# Altium schematic sheet Tape Array.SchDoc
size A; SheetNumber: 2; SheetTotal: 4
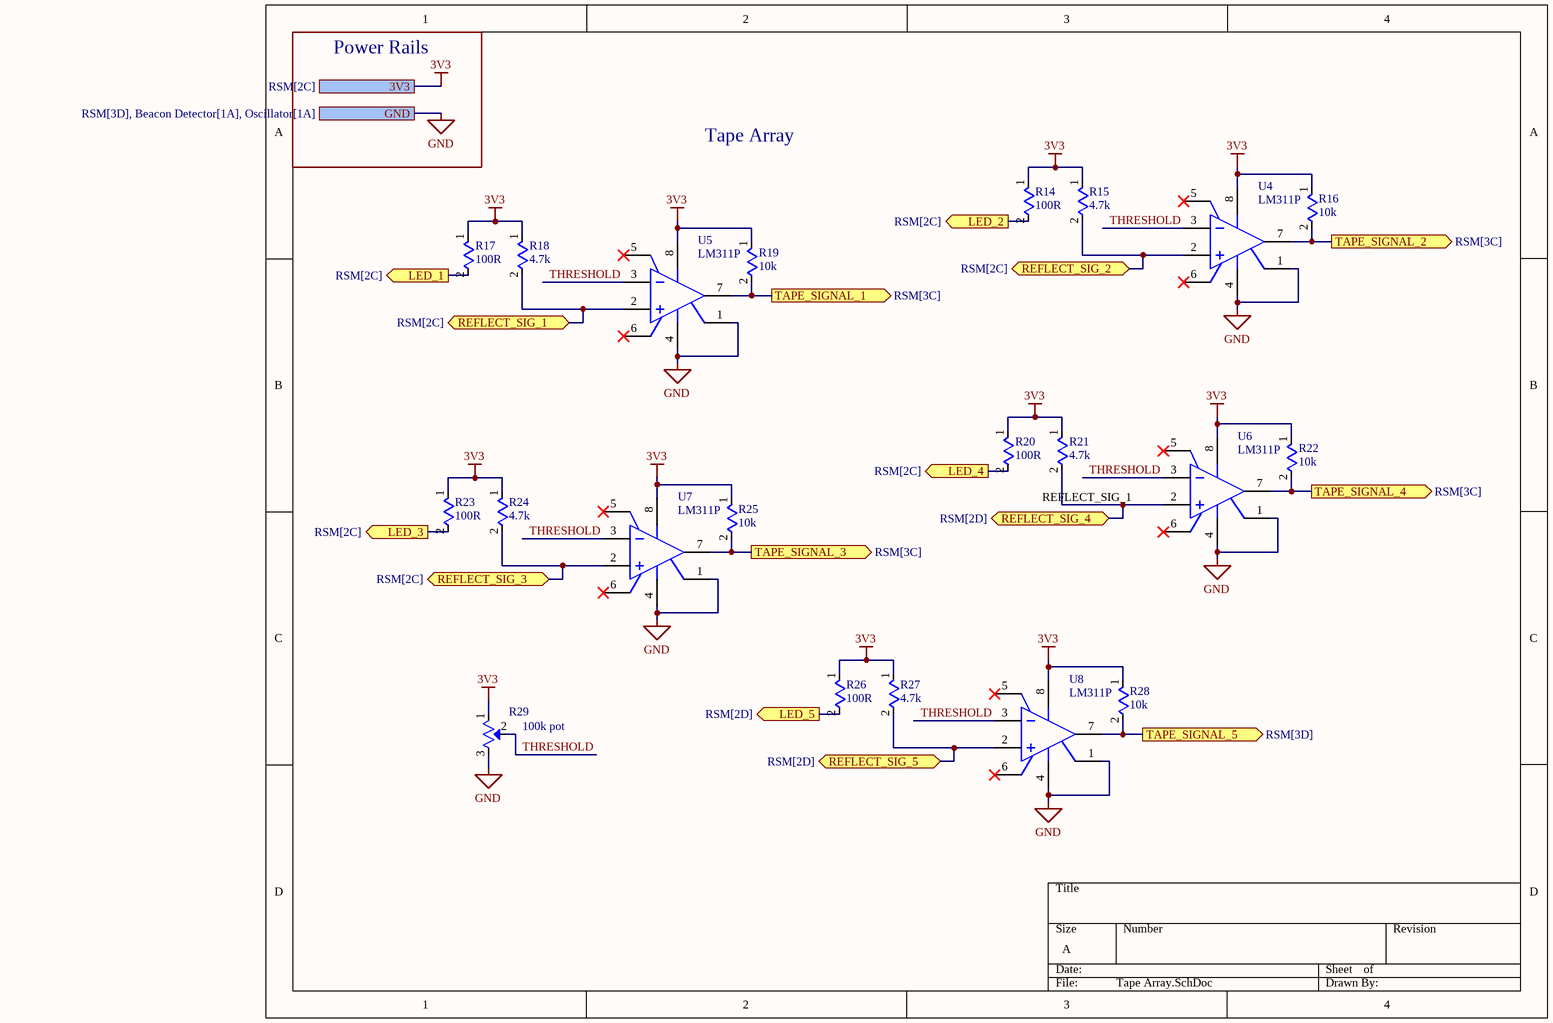
[diagram p0: Tape Array.SchDoc]

## Parts
R14  100R  [Axial 0.5]
R15  4.7k  [Axial 0.5]
R16  10k  [Axial 0.5]
R17  100R  [Axial 0.5]
R18  4.7k  [Axial 0.5]
R19  10k  [Axial 0.5]
R20  100R  [Axial 0.5]
R21  4.7k  [Axial 0.5]
R22  10k  [Axial 0.5]
R23  100R  [Axial 0.5]
R24  4.7k  [Axial 0.5]
R25  10k  [Axial 0.5]
R26  100R  [Axial 0.5]
R27  4.7k  [Axial 0.5]
R28  10k  [Axial 0.5]
R29  100k pot  [RES3_PV36W103C01B00_BRN]
U4  LM311P  [FP-P0008A-MFG]
U5  LM311P  [FP-P0008A-MFG]
U6  LM311P  [FP-P0008A-MFG]
U7  LM311P  [FP-P0008A-MFG]
U8  LM311P  [FP-P0008A-MFG]

## Ports
3V3 (see RSM[2C]), GND (see RSM[3D], Beacon Detector[1A], Oscillator[1A]), LED_1 (out, see RSM[2C]), LED_2 (out, see RSM[2C]), LED_3 (out, see RSM[2C]), LED_4 (out, see RSM[2C]), LED_5 (out, see RSM[2D]), REFLECT_SIG_1 (bidir, see RSM[2C]), REFLECT_SIG_2 (bidir, see RSM[2C]), REFLECT_SIG_3 (bidir, see RSM[2C]), REFLECT_SIG_4 (bidir, see RSM[2D]), REFLECT_SIG_5 (bidir, see RSM[2D]), TAPE_SIGNAL_1 (out, see RSM[3C]), TAPE_SIGNAL_2 (out, see RSM[3C]), TAPE_SIGNAL_3 (out, see RSM[3C]), TAPE_SIGNAL_4 (out, see RSM[3C]), TAPE_SIGNAL_5 (out, see RSM[3D])

## Nets
3V3: R14.1 R15.1 R16.1 R17.1 R18.1 R19.1 R20.1 R21.1 R22.1 R23.1 R24.1 R25.1 R26.1 R27.1 R28.1 R29.1 U4.8(VCC+) U5.8(VCC+) U6.8(VCC+) U7.8(VCC+) U8.8(VCC+) ; port 3V3
GND: R29.3 U4.1(EMIT_OUT) U4.4(VCC-) U5.1(EMIT_OUT) U5.4(VCC-) U6.1(EMIT_OUT) U6.4(VCC-) U7.1(EMIT_OUT) U7.4(VCC-) U8.1(EMIT_OUT) U8.4(VCC-) ; port GND
LED_1: R17.2 ; port LED_1
LED_2: R14.2 ; port LED_2
LED_3: R23.2 ; port LED_3
LED_4: R20.2 ; port LED_4
LED_5: R26.2 ; port LED_5
REFLECT_SIG_1: R18.2 U5.2(IN+) ; port REFLECT_SIG_1
REFLECT_SIG_2: R15.2 U4.2(IN+) ; port REFLECT_SIG_2
REFLECT_SIG_3: R24.2 U7.2(IN+) ; port REFLECT_SIG_3
REFLECT_SIG_4: R21.2 U6.2(IN+) ; port REFLECT_SIG_4
REFLECT_SIG_5: R27.2 U8.2(IN+) ; port REFLECT_SIG_5
TAPE_SIGNAL_1: R19.2 U5.7(COL_OUT) ; port TAPE_SIGNAL_1
TAPE_SIGNAL_2: R16.2 U4.7(COL_OUT) ; port TAPE_SIGNAL_2
TAPE_SIGNAL_3: R25.2 U7.7(COL_OUT) ; port TAPE_SIGNAL_3
TAPE_SIGNAL_4: R22.2 U6.7(COL_OUT) ; port TAPE_SIGNAL_4
TAPE_SIGNAL_5: R28.2 U8.7(COL_OUT) ; port TAPE_SIGNAL_5
THRESHOLD: R29.2 U4.3(IN-) U5.3(IN-) U6.3(IN-) U7.3(IN-) U8.3(IN-)

Not connected (* = marked no-connect by the designer): U4 5(BALANCE)* 6(BAL/STRB)*; U5 5(BALANCE)* 6(BAL/STRB)*; U6 5(BALANCE)* 6(BAL/STRB)*; U7 5(BALANCE)* 6(BAL/STRB)*; U8 5(BALANCE)* 6(BAL/STRB)*

## Notes on the sheet
- Power Rails
- Tape Array
- (near R21) REFLECT_SIG_1

## Library data of the parts
R14-R28 = RES_GENERIC
R29 = Trimmer pot
U4-U8 = CMP-1685-00016-2: Manufacturer Lifecycle Status: ACTIVE; NexarPartId: 24336; Output Type: TTL; Max Output Voltage: 7.5mV; Min Supply Voltage: 3.5V; Min Dual Supply Voltage: 1.75V; Max Supply Current: 7.5mA; Number of Elements: 1; Response Time: 165ns; Max Dual Supply Voltage: 15V; Max Supply Voltage: 30V; Max Junction Temperature (Tj): 150°C; Max Power Dissipation: 500mW; Input Offset Voltage (Vos): 2mV; Resistance: 390Ω; Operating Supply Voltage: 28V; Power Rating: 100mW; Dual Supply Voltage: 9V; Output Current per Channel: 50mA; Turn-On Delay Time: 115ns; Tolerance: 1%; Voltage Gain: 106.02dB; Input Bias Current: 250nA; Voltage Rating: 75V; Contact Plating: Gold; Case Code (Imperial): 0603; Number of Circuits: 1; Lifecycle Status: Production; Ambient Temperature Range High: 70°C; Radiation Hardening: No; Quiescent Current: 7.5mA; Number of Channels: 1; Max Operating Temperature: 70°C; Height: 5.08mm; Type: General Purpose; Case Code (Metric): 1608; Mount: Surface Mount, Through Hole; Case/Package: PDIP; Thickness: 3.9mm; REACH SVHC: No SVHC; Length: 9.81mm; RoHS: Compliant; Schedule B: 8542390000, 8542390000; Lead Free: Lead Free; Min Operating Temperature: 0°C; Width: 6.35mm; Output Current: 50mA; Packaging: Tape and Reel; Nominal Supply Current: 7.5mA; Weight: 2.012816mg; Propagation Delay: 115ns; Max Input Current: 250nA; Number of Pins: 8